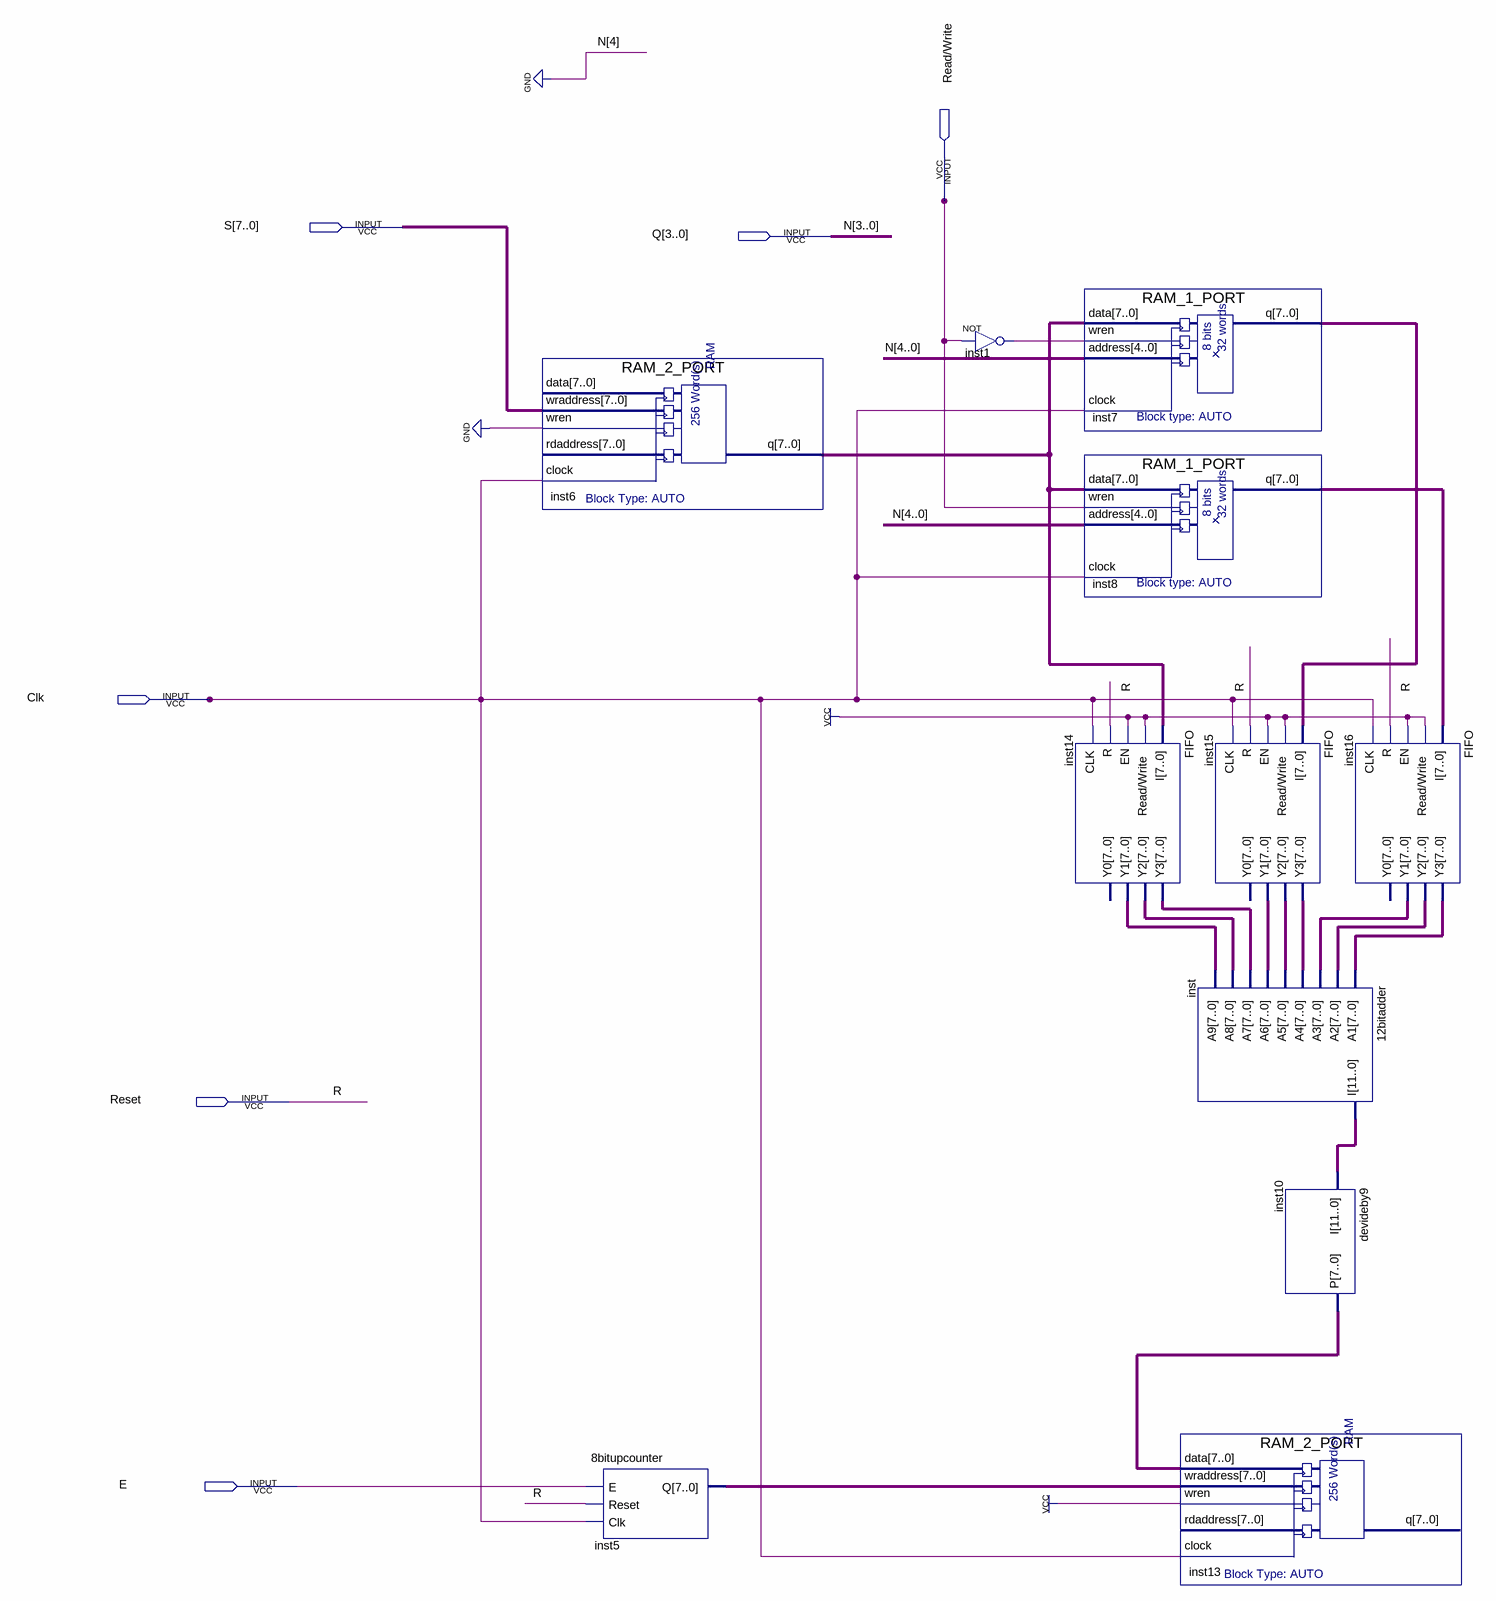
[diagram p0: schematic sheet]
// Quartus schematic Datapath.bdf as structural Verilog: 11 symbols, 6 pins
module Datapath (
  input  \Read/Write ,
  input  [7:0] S,
  input  [3:0] Q,
  input  Clk,
  input  Reset,
  input  E
);

  wire inst1_out;
  wire [7:0] inst5_q, inst6_q, inst7_q, inst8_q, inst10_p, inst14_y1, inst14_y2, inst14_y3, inst15_y1,
       inst15_y2, inst15_y3, inst16_y1, inst16_y2, inst16_y3;
  wire [11:0] inst_i;

  RAM_2_PORT inst6 (.wraddress(S), .wren(1'b0), .clock(Clk), .q(inst6_q));  // open: data, rdaddress
  \8bitupcounter  inst5 (.E(E), .Reset(Reset), .Clk(Clk), .Q(inst5_q));
  not inst1 (inst1_out, \Read/Write );
  FIFO inst14 (
    .I(inst6_q), .\Read/Write (1'b1), .EN(1'b1), .R(Reset), .CLK(Clk), .Y3(inst14_y3), .Y2(inst14_y2),
    .Y1(inst14_y1));  // open: Y0
  RAM_1_PORT inst7 (.data(inst6_q), .wren(inst1_out), .address({1'b0, Q}), .clock(Clk), .q(inst7_q));
  RAM_1_PORT inst8 (.data(inst6_q), .wren(\Read/Write ), .address({1'b0, Q}), .clock(Clk), .q(inst8_q));
  FIFO inst15 (
    .I(inst7_q), .\Read/Write (1'b1), .EN(1'b1), .R(Reset), .CLK(Clk), .Y3(inst15_y3), .Y2(inst15_y2),
    .Y1(inst15_y1));  // open: Y0
  \12bitadder  inst (
    .A1(inst16_y3), .A2(inst16_y2), .A3(inst16_y1), .A4(inst15_y3), .A5(inst15_y2), .A6(inst15_y1),
    .A7(inst14_y3), .A8(inst14_y2), .A9(inst14_y1), .I(inst_i));
  RAM_2_PORT inst13 (.data(inst10_p), .wraddress(inst5_q), .wren(1'b1), .clock(Clk));  // open: rdaddress, q
  devideby9 inst10 (.I(inst_i), .P(inst10_p));
  FIFO inst16 (
    .I(inst8_q), .\Read/Write (1'b1), .EN(1'b1), .R(Reset), .CLK(Clk), .Y3(inst16_y3), .Y2(inst16_y2),
    .Y1(inst16_y1));  // open: Y0

  // Other names for the same wires on the sheet: N[3:0] = Q; R = Reset
endmodule
